# Altium schematic sheet RELE.SchDoc
size A3; SheetNumber: 6; SheetTotal: 8
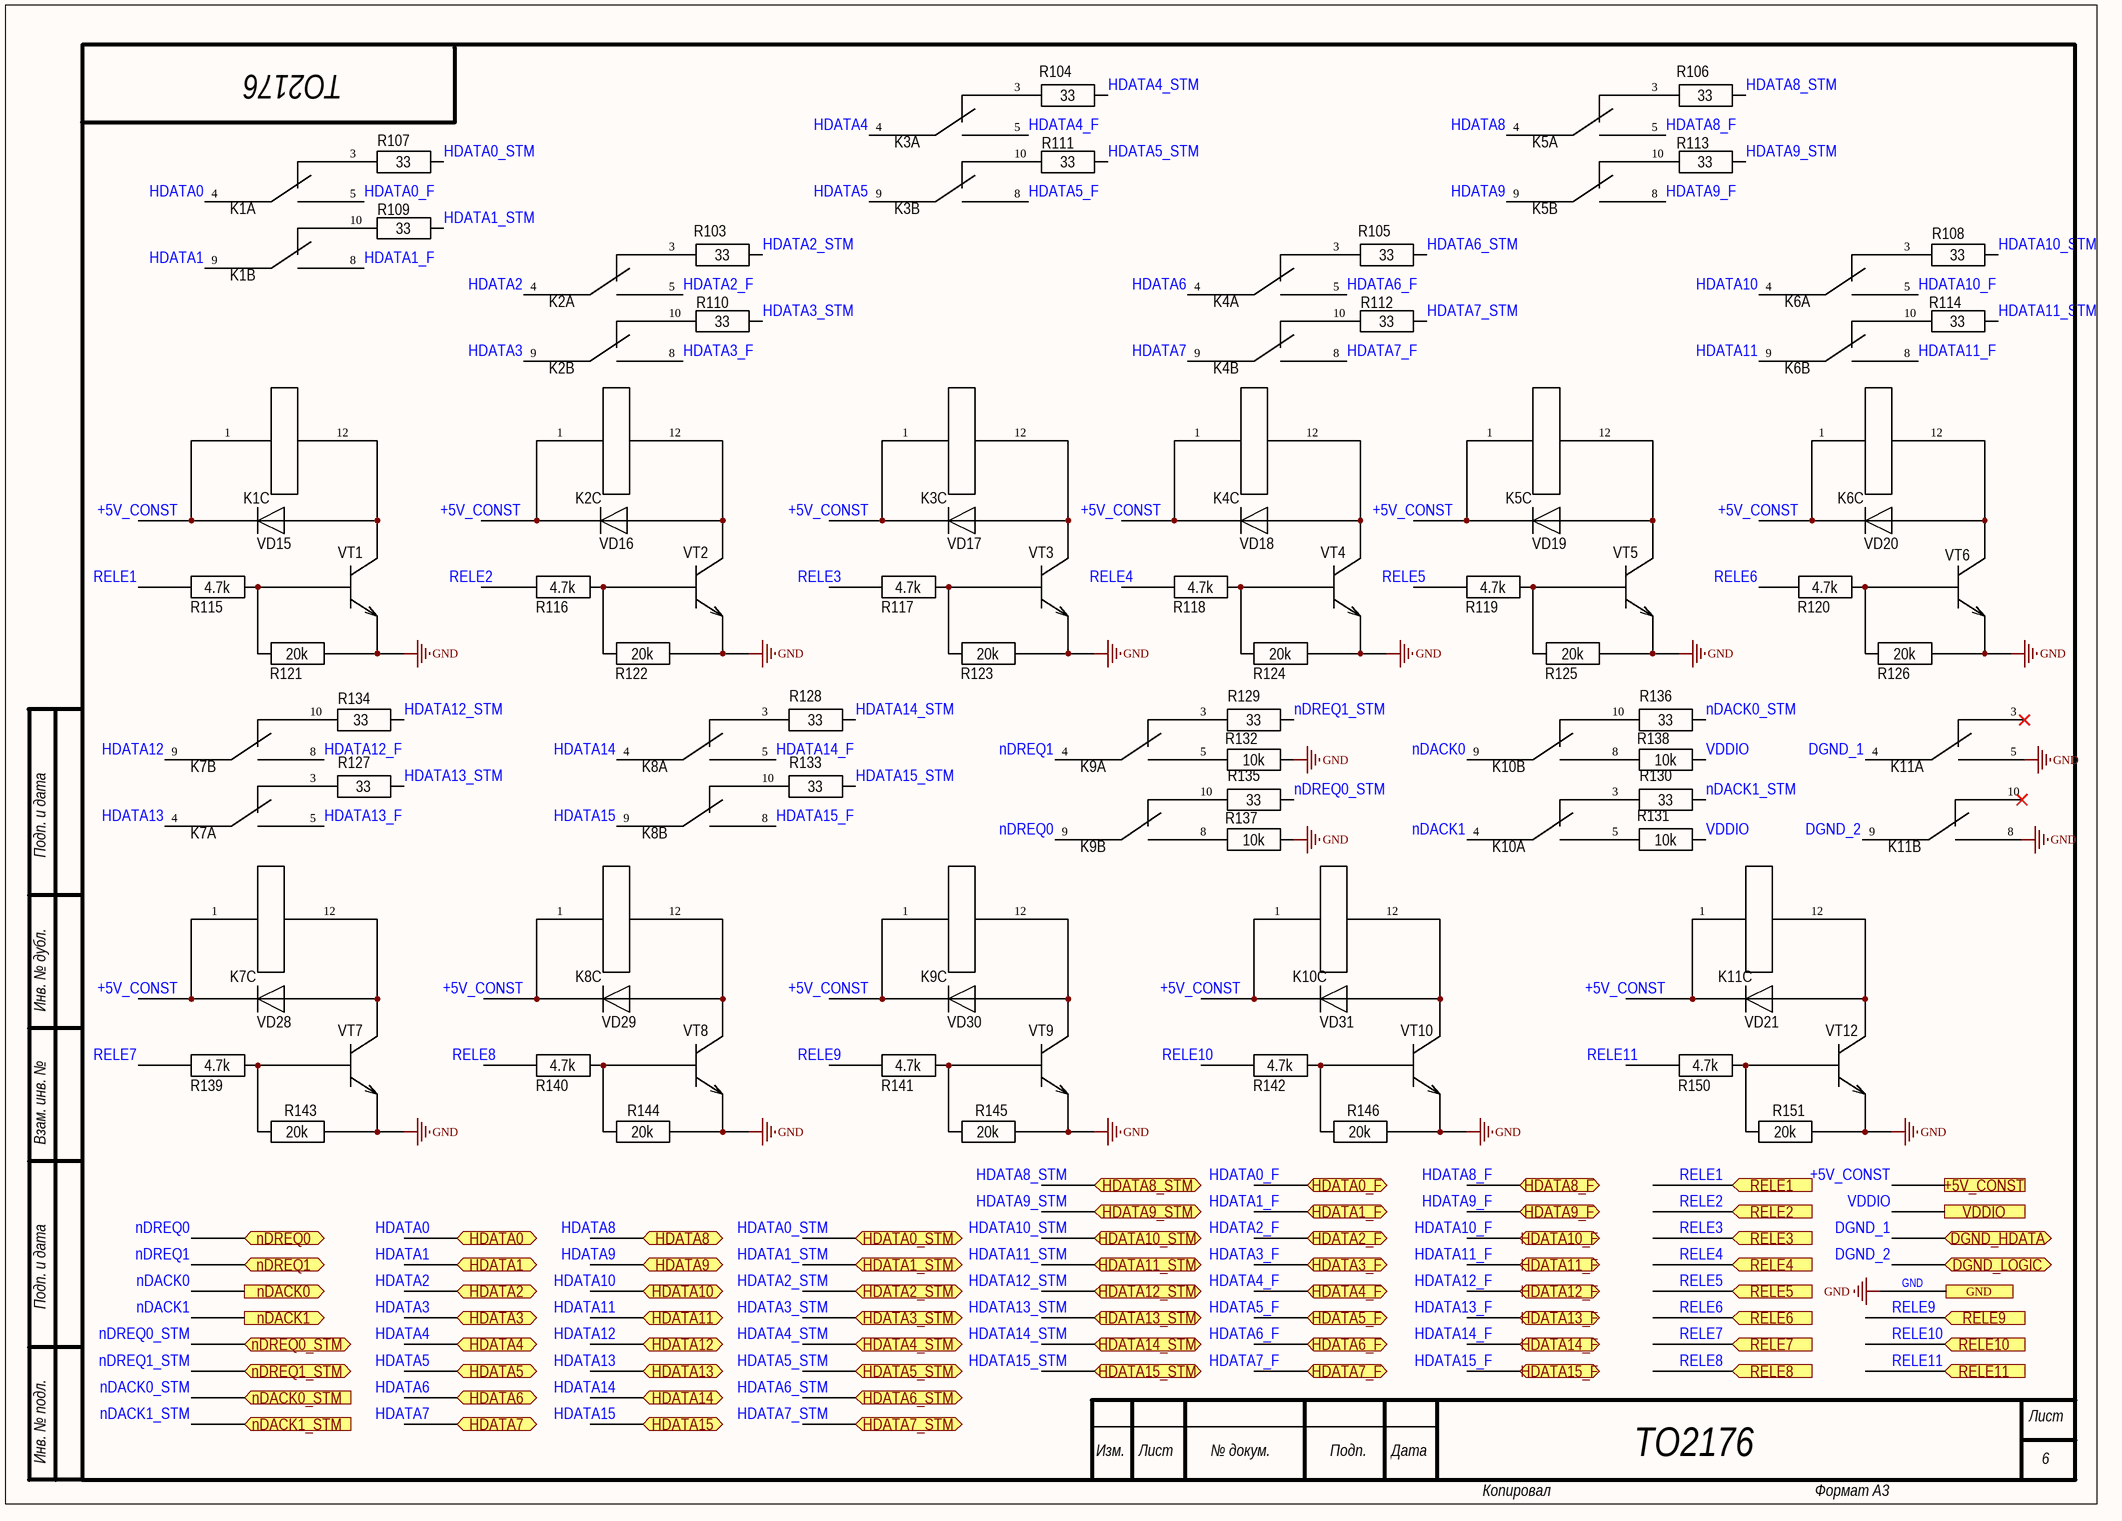
[diagram p0: RELE.SchDoc]

## Parts
K1  V23079A1001B301 TE  [V23079A1001B301]  (value not drawn)  (parts A,B,C of 3)
K2  V23079A1001B301 TE  [V23079A1001B301]  (value not drawn)  (parts A,B,C of 3)
K3  V23079A1001B301 TE  [V23079A1001B301]  (value not drawn)  (parts A,B,C of 3)
K4  V23079A1001B301 TE  [V23079A1001B301]  (value not drawn)  (parts A,B,C of 3)
K5  V23079A1001B301 TE  [V23079A1001B301]  (value not drawn)  (parts A,B,C of 3)
K6  V23079A1001B301 TE  [V23079A1001B301]  (value not drawn)  (parts A,B,C of 3)
K7  V23079A1001B301 TE  [V23079A1001B301]  (value not drawn)  (parts A,B,C of 3)
K8  V23079A1001B301 TE  [V23079A1001B301]  (value not drawn)  (parts A,B,C of 3)
K9  V23079A1001B301 TE  [V23079A1001B301]  (value not drawn)  (parts A,B,C of 3)
K10  V23079A1001B301 TE  [V23079A1001B301]  (value not drawn)  (parts A,B,C of 3)
K11  V23079A1001B301 TE  [V23079A1001B301]  (value not drawn)  (parts A,B,C of 3)
R103  33  [0603]
R104  33  [0603]
R105  33  [0603]
R106  33  [0603]
R107  33  [0603]
R108  33  [0603]
R109  33  [0603]
R110  33  [0603]
R111  33  [0603]
R112  33  [0603]
R113  33  [0603]
R114  33  [0603]
R115  4.7k  [0805]
R116  4.7k  [0805]
R117  4.7k  [0805]
R118  4.7k  [0805]
R119  4.7k  [0805]
R120  4.7k  [0805]
R121  20k  [0805]
R122  20k  [0805]
R123  20k  [0805]
R124  20k  [0805]
R125  20k  [0805]
R126  20k  [0805]
R127  33  [0603]
R128  33  [0603]
R129  33  [0603]
R130  33  [0603]
R131  10k  [0603]
R132  10k  [0603]
R133  33  [0603]
R134  33  [0603]
R135  33  [0603]
R136  33  [0603]
R137  10k  [0603]
R138  10k  [0603]
R139  4.7k  [0805]
R140  4.7k  [0805]
R141  4.7k  [0805]
R142  4.7k  [0805]
R143  20k  [0805]
R144  20k  [0805]
R145  20k  [0805]
R146  20k  [0805]
R150  4.7k  [0805]
R151  20k  [0805]
VD15  LL4148 NXP  [SOD80C]  (value not drawn)
VD16  LL4148 NXP  [SOD80C]  (value not drawn)
VD17  LL4148 NXP  [SOD80C]  (value not drawn)
VD18  LL4148 NXP  [SOD80C]  (value not drawn)
VD19  LL4148 NXP  [SOD80C]  (value not drawn)
VD20  LL4148 NXP  [SOD80C]  (value not drawn)
VD21  LL4148 NXP  [SOD80C]  (value not drawn)
VD28  LL4148 NXP  [SOD80C]  (value not drawn)
VD29  LL4148 NXP  [SOD80C]  (value not drawn)
VD30  LL4148 NXP  [SOD80C]  (value not drawn)
VD31  LL4148 NXP  [SOD80C]  (value not drawn)
VT1  MMBT5551L  [SOT-23]  (value not drawn)
VT2  MMBT5551L  [SOT-23]  (value not drawn)
VT3  MMBT5551L  [SOT-23]  (value not drawn)
VT4  MMBT5551L  [SOT-23]  (value not drawn)
VT5  MMBT5551L  [SOT-23]  (value not drawn)
VT6  MMBT5551L  [SOT-23]  (value not drawn)
VT7  MMBT5551L  [SOT-23]  (value not drawn)
VT8  MMBT5551L  [SOT-23]  (value not drawn)
VT9  MMBT5551L  [SOT-23]  (value not drawn)
VT10  MMBT5551L  [SOT-23]  (value not drawn)
VT12  MMBT5551L  [SOT-23]  (value not drawn)

## Ports
+5V_CONST, DGND_HDATA (bidir), DGND_LOGIC (bidir), GND, HDATA0 (bidir), HDATA0_F (bidir), HDATA0_STM (bidir), HDATA1 (bidir), HDATA1_F (bidir), HDATA1_STM (bidir), HDATA2 (bidir), HDATA2_F (bidir), HDATA2_STM (bidir), HDATA3 (bidir), HDATA3_F (bidir), HDATA3_STM (bidir), HDATA4 (bidir), HDATA4_F (bidir), HDATA4_STM (bidir), HDATA5 (bidir), HDATA5_F (bidir), HDATA5_STM (bidir), HDATA6 (bidir), HDATA6_F (bidir), HDATA6_STM (bidir), HDATA7 (bidir), HDATA7_F (bidir), HDATA7_STM (bidir), HDATA8 (bidir), HDATA8_F (bidir), HDATA8_STM (bidir), HDATA9 (bidir), HDATA9_F (bidir), HDATA9_STM (bidir), HDATA10 (bidir), HDATA10_F (bidir), HDATA10_STM (bidir), HDATA11 (bidir), HDATA11_F (bidir), HDATA11_STM (bidir), HDATA12 (bidir), HDATA12_F (bidir), HDATA12_STM (bidir), HDATA13 (bidir), HDATA13_F (bidir), HDATA13_STM (bidir), HDATA14 (bidir), HDATA14_F (bidir), HDATA14_STM (bidir), HDATA15 (bidir), HDATA15_F (bidir), HDATA15_STM (bidir), nDACK0 (out), nDACK0_STM (in), nDACK1 (out), nDACK1_STM (in), nDREQ0 (bidir), nDREQ0_STM (bidir), nDREQ1 (bidir), nDREQ1_STM (bidir), RELE1 (in), RELE2 (in), RELE3 (in), RELE4 (in), RELE5 (in), RELE6 (in), RELE7 (in), RELE8 (in), RELE9 (in), RELE10 (in), RELE11 (in), VDDIO

## Nets
GND: K11.5 K11.8 R121.1 R122.1 R123.1 R124.1 R125.1 R126.1 R132.2 R137.2 R143.1 R144.1 R145.1 R146.1 R151.1 VT1.2(E) VT2.2(E) VT3.2(E) VT4.2(E) VT5.2(E) VT6.2(E) VT7.2(E) VT8.2(E) VT9.2(E) VT10.2(E) VT12.2(E) ; port GND
+5V_CONST: K1.1 K2.1 K3.1 K4.1 K5.1 K6.1 K7.1 K8.1 K9.1 K10.1 K11.1 VD15.2(K) VD16.2(K) VD17.2(K) VD18.2(K) VD19.2(K) VD20.2(K) VD21.2(K) VD28.2(K) VD29.2(K) VD30.2(K) VD31.2(K) ; port +5V_CONST
DGND_1: K11.4 ; port DGND_HDATA
DGND_2: K11.9 ; port DGND_LOGIC
HDATA0: K1.4 ; port HDATA0
HDATA0_F: K1.5 ; port HDATA0_F
HDATA0_STM: R107.2 ; port HDATA0_STM
HDATA1: K1.9 ; port HDATA1
HDATA1_F: K1.8 ; port HDATA1_F
HDATA1_STM: R109.2 ; port HDATA1_STM
HDATA2: K2.4 ; port HDATA2
HDATA2_F: K2.5 ; port HDATA2_F
HDATA2_STM: R103.2 ; port HDATA2_STM
HDATA3: K2.9 ; port HDATA3
HDATA3_F: K2.8 ; port HDATA3_F
HDATA3_STM: R110.2 ; port HDATA3_STM
HDATA4: K3.4 ; port HDATA4
HDATA4_F: K3.5 ; port HDATA4_F
HDATA4_STM: R104.2 ; port HDATA4_STM
HDATA5: K3.9 ; port HDATA5
HDATA5_F: K3.8 ; port HDATA5_F
HDATA5_STM: R111.2 ; port HDATA5_STM
HDATA6: K4.4 ; port HDATA6
HDATA6_F: K4.5 ; port HDATA6_F
HDATA6_STM: R105.2 ; port HDATA6_STM
HDATA7: K4.9 ; port HDATA7
HDATA7_F: K4.8 ; port HDATA7_F
HDATA7_STM: R112.2 ; port HDATA7_STM
HDATA8: K5.4 ; port HDATA8
HDATA8_F: K5.5 ; port HDATA8_F
HDATA8_STM: R106.2 ; port HDATA8_STM
HDATA9: K5.9 ; port HDATA9
HDATA9_F: K5.8 ; port HDATA9_F
HDATA9_STM: R113.2 ; port HDATA9_STM
HDATA10: K6.4 ; port HDATA10
HDATA10_F: K6.5 ; port HDATA10_F
HDATA10_STM: R108.2 ; port HDATA10_STM
HDATA11: K6.9 ; port HDATA11
HDATA11_F: K6.8 ; port HDATA11_F
HDATA11_STM: R114.2 ; port HDATA11_STM
HDATA12: K7.9 ; port HDATA12
HDATA12_F: K7.8 ; port HDATA12_F
HDATA12_STM: R134.2 ; port HDATA12_STM
HDATA13: K7.4 ; port HDATA13
HDATA13_F: K7.5 ; port HDATA13_F
HDATA13_STM: R127.2 ; port HDATA13_STM
HDATA14: K8.4 ; port HDATA14
HDATA14_F: K8.5 ; port HDATA14_F
HDATA14_STM: R128.2 ; port HDATA14_STM
HDATA15: K8.9 ; port HDATA15
HDATA15_F: K8.8 ; port HDATA15_F
HDATA15_STM: R133.2 ; port HDATA15_STM
nDACK0: K10.9 ; port nDACK0
nDACK0_STM: R136.2 ; port nDACK0_STM
nDACK1: K10.4 ; port nDACK1
nDACK1_STM: R130.2 ; port nDACK1_STM
nDREQ0: K9.9 ; port nDREQ0
nDREQ0_STM: R135.2 ; port nDREQ0_STM
nDREQ1: K9.4 ; port nDREQ1
nDREQ1_STM: R129.2 ; port nDREQ1_STM
RELE1: R115.2 ; port RELE1
RELE2: R116.2 ; port RELE2
RELE3: R117.2 ; port RELE3
RELE4: R118.2 ; port RELE4
RELE5: R119.2 ; port RELE5
RELE6: R120.2 ; port RELE6
RELE7: R139.2 ; port RELE7
RELE8: R140.2 ; port RELE8
RELE9: R141.2 ; port RELE9
RELE10: R142.2 ; port RELE10
RELE11: R150.2 ; port RELE11
VDDIO: R131.2 R138.2 ; port VDDIO
NetK1_3: K1.3 R107.1
NetK1_10: K1.10 R109.1
NetK1_12: K1.12 VD15.1(A) VT1.3(K)
NetK2_3: K2.3 R103.1
NetK2_10: K2.10 R110.1
NetK2_12: K2.12 VD16.1(A) VT2.3(K)
NetK3_3: K3.3 R104.1
NetK3_10: K3.10 R111.1
NetK3_12: K3.12 VD17.1(A) VT3.3(K)
NetK4_3: K4.3 R105.1
NetK4_10: K4.10 R112.1
NetK4_12: K4.12 VD18.1(A) VT4.3(K)
NetK5_3: K5.3 R106.1
NetK5_10: K5.10 R113.1
NetK5_12: K5.12 VD19.1(A) VT5.3(K)
NetK6_3: K6.3 R108.1
NetK6_10: K6.10 R114.1
NetK6_12: K6.12 VD20.1(A) VT6.3(K)
NetK7_3: K7.3 R127.1
NetK7_10: K7.10 R134.1
NetK7_12: K7.12 VD28.1(A) VT7.3(K)
NetK8_3: K8.3 R128.1
NetK8_10: K8.10 R133.1
NetK8_12: K8.12 VD29.1(A) VT8.3(K)
NetK9_3: K9.3 R129.1
NetK9_5: K9.5 R132.1
NetK9_8: K9.8 R137.1
NetK9_10: K9.10 R135.1
NetK9_12: K9.12 VD30.1(A) VT9.3(K)
NetK10_3: K10.3 R130.1
NetK10_5: K10.5 R131.1
NetK10_8: K10.8 R138.1
NetK10_10: K10.10 R136.1
NetK10_12: K10.12 VD31.1(A) VT10.3(K)
NetK11_12: K11.12 VD21.1(A) VT12.3(K)
NetR115_1: R115.1 R121.2 VT1.1(B)
NetR116_1: R116.1 R122.2 VT2.1(B)
NetR117_1: R117.1 R123.2 VT3.1(B)
NetR118_1: R118.1 R124.2 VT4.1(B)
NetR119_1: R119.1 R125.2 VT5.1(B)
NetR120_1: R120.1 R126.2 VT6.1(B)
NetR139_1: R139.1 R143.2 VT7.1(B)
NetR140_1: R140.1 R144.2 VT8.1(B)
NetR141_1: R141.1 R145.2 VT9.1(B)
NetR142_1: R142.1 R146.2 VT10.1(B)
NetR150_1: R150.1 R151.2 VT12.1(B)

Not connected (* = marked no-connect by the designer): K11 3* 10*

## Notes on the sheet
- ТО2176
- Подп. и дата
- Инв. № дубл.
- Взам. инв. №
- Инв. № подл.
- Изм.
- Лист
- № докум.
- Подп.
- Дата
- 6
- Копировал
- Формат А3

## Library data of the parts
R103-R114 R127-R138 = R0603 Yageo: ComponentHeigt: 0.5; Leadform: SMD; Firme: Yageo; Kind: Резистор; Packaging: 0402; ClassName: *; Component Link: *; NN: *
R115-R126 R139-R146 R150 R151 = R0805 Yageo: ComponentHeigt: 0.6; Firme: Yageo; Leadform: SMD; Kind: Резистор; ClassName: *; ComponentWeigt: *; Component Link: *; Packaging: 0805; NN: *; Value: *
VD15-VD21 VD28-VD31 = LL4148 NXP: ComponentHeigt: 1.6; Leadform: SMD; NN: 24009301; KIND: Диод LL4148 NXP; Component Link: http://www.nxp.com; Packaging: SOD-80C; ClassName: *; Firme: NXP
VT1-VT10 VT12 = MMBT5551L: ComponentHeigt: 1.1; Firme: ONS; Leadform: SMD; NN: 24007468; KIND: Транзистор MMBT5551L*G ONS; ClassName: *; ComponentWeigt: *; Packaging: SOT-23